# Altium schematic sheet blinky.SchDoc
size E
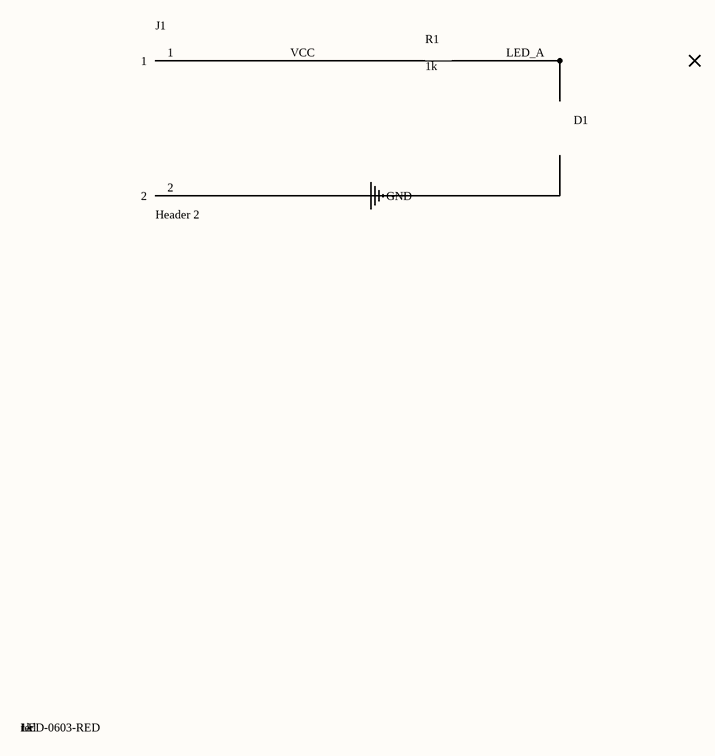
[diagram p0: blinky.SchDoc]

## Parts
D1  value red  Manufacturer Part Number: LED-0603-RED  [LED0603]
J1  Header 2  [HDR1X2]
R1  1k  [R0603]

## Nets
GND: D1.2(K) J1.2
LED_A: D1.1(A) R1.2
VCC: J1.1 R1.1

## Library data of the parts
D1 = LED
J1 = Header2
R1 = Res: Value: 1k